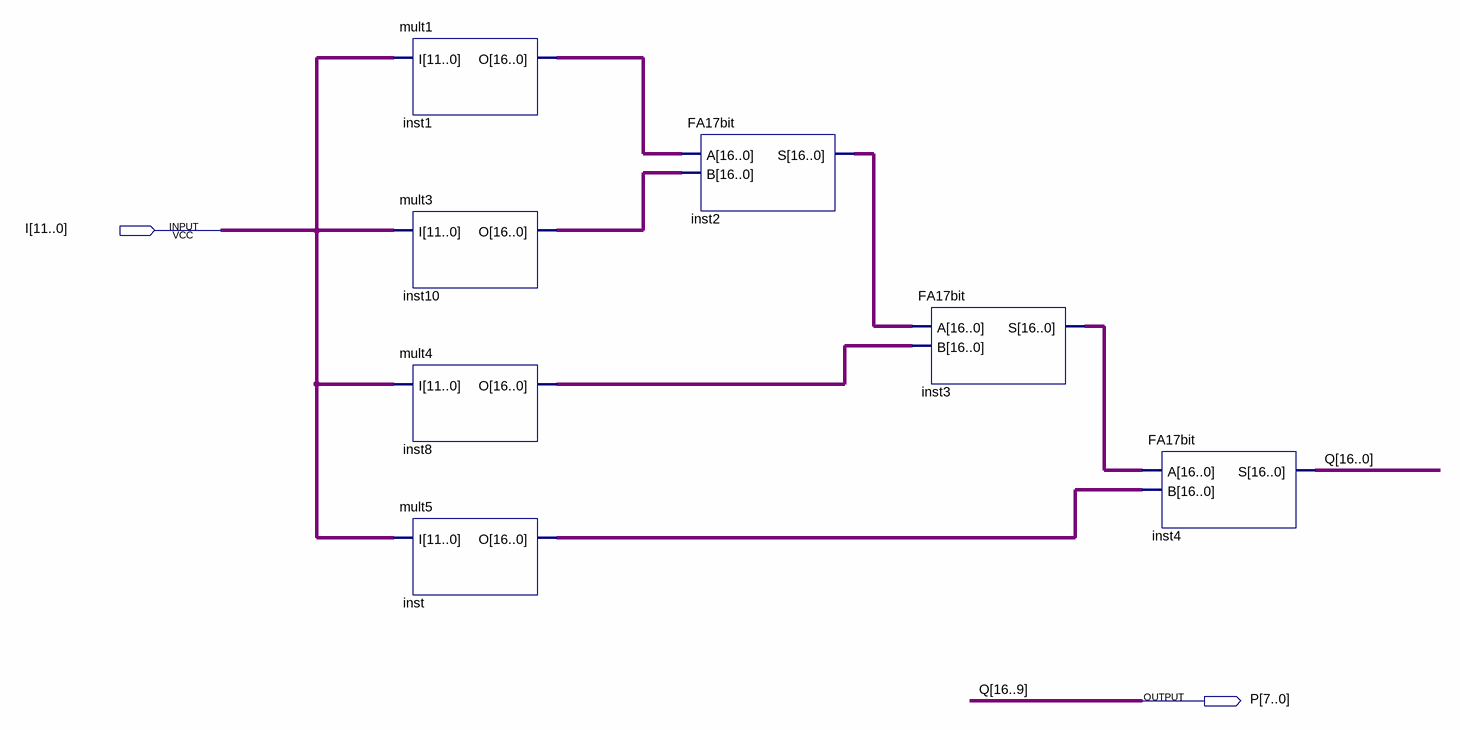
[diagram p0: schematic sheet]
// Quartus schematic devideby9.bdf as structural Verilog: 7 symbols, 2 pins
module devideby9 (
  input  [11:0] I,
  output [7:0] P
);

  wire [8:0] Q;
  wire [16:0] inst1_o, inst2_s, inst3_s, inst8_o, inst10_o, inst_o;

  mult1 inst1 (.I(I), .O(inst1_o));
  mult3 inst10 (.I(I), .O(inst10_o));
  mult4 inst8 (.I(I), .O(inst8_o));
  mult5 inst (.I(I), .O(inst_o));
  FA17bit inst2 (.A(inst1_o), .B(inst10_o), .S(inst2_s));
  FA17bit inst3 (.A(inst2_s), .B(inst8_o), .S(inst3_s));
  FA17bit inst4 (.A(inst3_s), .B(inst_o), .S({P, Q}));

  // Other names for the same wires on the sheet: Q[16:9] = P
endmodule
